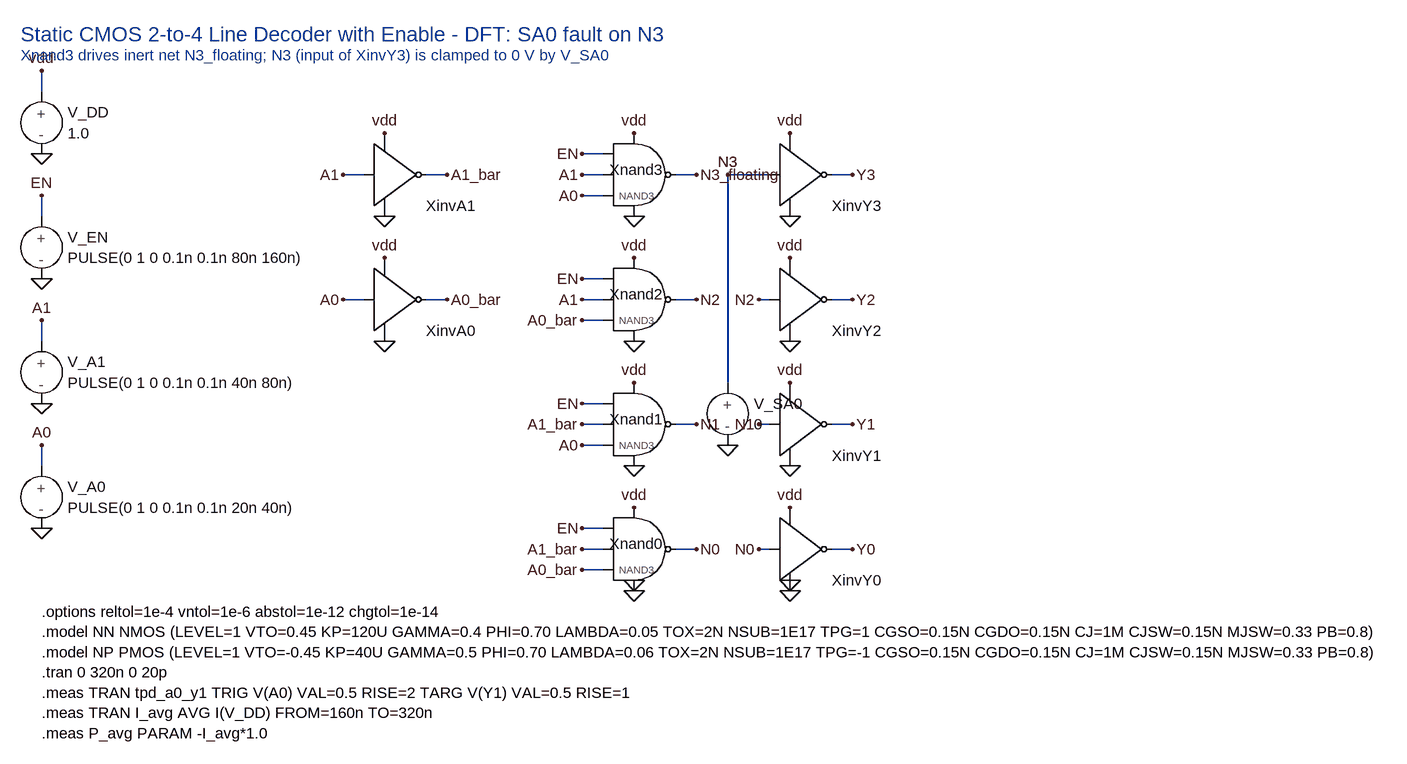
[diagram p0: schematic decoder_dft_sa0.asc]
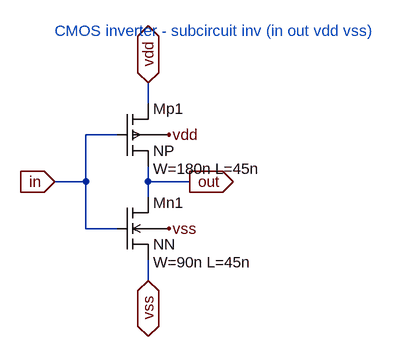
[diagram p1: sub-circuit inv.asc]
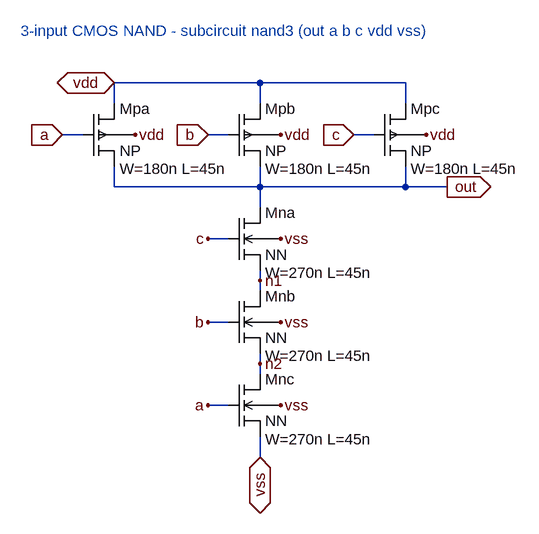
[diagram p2: sub-circuit nand3.asc]
decoder_dft_sa0.asc, the LTspice schematic file:
Version 4
SHEET 1 1744 1248
TEXT 64 24 Left 3 ;Static CMOS 2-to-4 Line Decoder with Enable - DFT: SA0 fault on N3
TEXT 64 56 Left 2 ;Xnand3 drives inert net N3_floating; N3 (input of XinvY3) is clamped to 0 V by V_SA0
SYMBOL vsrc_tb 96 112 R0
SYMATTR InstName V_DD
SYMATTR Value 1.0
WIRE 96 112 96 80
FLAG 96 80 vdd
FLAG 96 208 0
SYMBOL vsrc_tb 96 304 R0
SYMATTR InstName V_EN
SYMATTR Value PULSE(0 1 0 0.1n 0.1n 80n 160n)
WIRE 96 304 96 272
FLAG 96 272 EN
FLAG 96 400 0
SYMBOL vsrc_tb 96 496 R0
SYMATTR InstName V_A1
SYMATTR Value PULSE(0 1 0 0.1n 0.1n 40n 80n)
WIRE 96 496 96 464
FLAG 96 464 A1
FLAG 96 592 0
SYMBOL vsrc_tb 96 688 R0
SYMATTR InstName V_A0
SYMATTR Value PULSE(0 1 0 0.1n 0.1n 20n 40n)
WIRE 96 688 96 656
FLAG 96 656 A0
FLAG 96 784 0
SYMBOL inv 592 192 R0
SYMATTR InstName XinvA1
WIRE 592 240 560 240
FLAG 560 240 A1
WIRE 688 240 720 240
FLAG 720 240 A1_bar
FLAG 624 176 vdd
FLAG 624 304 0
SYMBOL inv 592 384 R0
SYMATTR InstName XinvA0
WIRE 592 432 560 432
FLAG 560 432 A0
WIRE 688 432 720 432
FLAG 720 432 A0_bar
FLAG 624 368 vdd
FLAG 624 496 0
SYMBOL nand3 960 192 R0
SYMATTR InstName Xnand3
WIRE 960 208 928 208
FLAG 928 208 EN
WIRE 960 240 928 240
FLAG 928 240 A1
WIRE 960 272 928 272
FLAG 928 272 A0
FLAG 1008 176 vdd
FLAG 1008 304 0
WIRE 1072 240 1104 240
FLAG 1104 240 N3_floating
SYMBOL inv 1216 192 R0
SYMATTR InstName XinvY3
WIRE 1216 240 1152 240
FLAG 1152 240 N3
FLAG 1248 176 vdd
FLAG 1248 304 0
WIRE 1312 240 1344 240
FLAG 1344 240 Y3
SYMBOL vsrc_tb 1152 560 R0
SYMATTR InstName V_SA0
SYMATTR Value 0
WIRE 1152 560 1152 240
FLAG 1152 240 N3
FLAG 1152 656 0
SYMBOL nand3 960 384 R0
SYMATTR InstName Xnand2
WIRE 960 400 928 400
FLAG 928 400 EN
WIRE 960 432 928 432
FLAG 928 432 A1
WIRE 960 464 928 464
FLAG 928 464 A0_bar
FLAG 1008 368 vdd
FLAG 1008 496 0
WIRE 1072 432 1104 432
FLAG 1104 432 N2
SYMBOL inv 1216 384 R0
SYMATTR InstName XinvY2
WIRE 1216 432 1200 432
FLAG 1200 432 N2
FLAG 1248 368 vdd
FLAG 1248 496 0
WIRE 1312 432 1344 432
FLAG 1344 432 Y2
SYMBOL nand3 960 576 R0
SYMATTR InstName Xnand1
WIRE 960 592 928 592
FLAG 928 592 EN
WIRE 960 624 928 624
FLAG 928 624 A1_bar
WIRE 960 656 928 656
FLAG 928 656 A0
FLAG 1008 560 vdd
FLAG 1008 688 0
WIRE 1072 624 1104 624
FLAG 1104 624 N1
SYMBOL inv 1216 576 R0
SYMATTR InstName XinvY1
WIRE 1216 624 1200 624
FLAG 1200 624 N1
FLAG 1248 560 vdd
FLAG 1248 688 0
WIRE 1312 624 1344 624
FLAG 1344 624 Y1
SYMBOL nand3 960 768 R0
SYMATTR InstName Xnand0
WIRE 960 784 928 784
FLAG 928 784 EN
WIRE 960 816 928 816
FLAG 928 816 A1_bar
WIRE 960 848 928 848
FLAG 928 848 A0_bar
FLAG 1008 752 vdd
FLAG 1008 864 0
FLAG 1008 880 0
WIRE 1072 816 1104 816
FLAG 1104 816 N0
SYMBOL inv 1216 768 R0
SYMATTR InstName XinvY0
WIRE 1216 816 1200 816
FLAG 1200 816 N0
FLAG 1248 752 vdd
FLAG 1248 864 0
FLAG 1248 880 0
WIRE 1312 816 1344 816
FLAG 1344 816 Y0
TEXT 96 912 Left 2 !.options reltol=1e-4 vntol=1e-6 abstol=1e-12 chgtol=1e-14\n.model NN NMOS (LEVEL=1 VTO=0.45 KP=120U GAMMA=0.4 PHI=0.70 LAMBDA=0.05 TOX=2N NSUB=1E17 TPG=1 CGSO=0.15N CGDO=0.15N CJ=1M CJSW=0.15N MJSW=0.33 PB=0.8)\n.model NP PMOS (LEVEL=1 VTO=-0.45 KP=40U GAMMA=0.5 PHI=0.70 LAMBDA=0.06 TOX=2N NSUB=1E17 TPG=-1 CGSO=0.15N CGDO=0.15N CJ=1M CJSW=0.15N MJSW=0.33 PB=0.8)\n.tran 0 320n 0 20p\n.meas TRAN tpd_a0_y1 TRIG V(A0) VAL=0.5 RISE=2 TARG V(Y1) VAL=0.5 RISE=1\n.meas TRAN I_avg AVG I(V_DD) FROM=160n TO=320n\n.meas P_avg PARAM -I_avg*1.0

inv.asc, the sub-circuit schematic file:
Version 4
SHEET 1 1100 800
TEXT 64 -16 Left 2 ;CMOS inverter - subcircuit inv (in out vdd vss)
SYMBOL mp 160 96 R0
SYMATTR InstName Mp1
SYMATTR Value NP
SYMATTR SpiceLine W=180n L=45n
SYMBOL mn 160 240 R0
SYMATTR InstName Mn1
SYMATTR Value NN
SYMATTR SpiceLine W=90n L=45n
WIRE 208 96 208 64
FLAG 208 64 vdd
IOPIN 208 64 BiDir
FLAG 240 144 vdd
WIRE 208 192 208 216
WIRE 208 216 208 240
WIRE 208 216 272 216
FLAG 272 216 out
IOPIN 272 216 Out
WIRE 160 144 112 144
WIRE 112 144 112 216
WIRE 112 216 112 288
WIRE 112 288 160 288
WIRE 112 216 64 216
FLAG 64 216 in
IOPIN 64 216 In
FLAG 240 288 vss
WIRE 208 336 208 368
FLAG 208 368 vss
IOPIN 208 368 BiDir

nand3.asc, the sub-circuit schematic file:
Version 4
SHEET 1 1100 840
TEXT 64 -16 Left 2 ;3-input CMOS NAND - subcircuit nand3 (out a b c vdd vss)
SYMBOL mp 160 96 R0
SYMATTR InstName Mpa
SYMATTR Value NP
SYMATTR SpiceLine W=180n L=45n
WIRE 208 96 208 64
FLAG 240 144 vdd
WIRE 160 144 128 144
FLAG 128 144 a
IOPIN 128 144 In
WIRE 208 192 208 224
SYMBOL mp 384 96 R0
SYMATTR InstName Mpb
SYMATTR Value NP
SYMATTR SpiceLine W=180n L=45n
WIRE 432 96 432 64
FLAG 464 144 vdd
WIRE 384 144 352 144
FLAG 352 144 b
IOPIN 352 144 In
WIRE 432 192 432 224
SYMBOL mp 608 96 R0
SYMATTR InstName Mpc
SYMATTR Value NP
SYMATTR SpiceLine W=180n L=45n
WIRE 656 96 656 64
FLAG 688 144 vdd
WIRE 608 144 576 144
FLAG 576 144 c
IOPIN 576 144 In
WIRE 656 192 656 224
WIRE 208 64 432 64
WIRE 432 64 656 64
FLAG 208 64 vdd
IOPIN 208 64 BiDir
WIRE 208 224 432 224
WIRE 432 224 656 224
WIRE 656 224 720 224
FLAG 720 224 out
IOPIN 720 224 Out
WIRE 432 224 432 256
SYMBOL mn 384 256 R0
SYMATTR InstName Mna
SYMATTR Value NN
SYMATTR SpiceLine W=270n L=45n
FLAG 464 304 vss
WIRE 384 304 352 304
FLAG 352 304 c
SYMBOL mn 384 384 R0
SYMATTR InstName Mnb
SYMATTR Value NN
SYMATTR SpiceLine W=270n L=45n
FLAG 464 432 vss
WIRE 384 432 352 432
FLAG 352 432 b
SYMBOL mn 384 512 R0
SYMATTR InstName Mnc
SYMATTR Value NN
SYMATTR SpiceLine W=270n L=45n
FLAG 464 560 vss
WIRE 384 560 352 560
FLAG 352 560 a
WIRE 432 352 432 368
WIRE 432 368 432 384
FLAG 432 368 n1
WIRE 432 480 432 496
WIRE 432 496 432 512
FLAG 432 496 n2
WIRE 432 608 432 640
FLAG 432 640 vss
IOPIN 432 640 BiDir

The netlist it stands for:
* decoder_dft_sa0.asc
V_DD vdd 0 1.0
V_EN EN 0 PULSE(0 1 0 0.1n 0.1n 80n 160n)
V_A1 A1 0 PULSE(0 1 0 0.1n 0.1n 40n 80n)
V_A0 A0 0 PULSE(0 1 0 0.1n 0.1n 20n 40n)
XXinvA1 A1 A1_bar vdd 0 inv
XXinvA0 A0 A0_bar vdd 0 inv
XXnand3 N3_floating EN A1 A0 vdd 0 nand3
XXinvY3 N3 Y3 vdd 0 inv
V_SA0 N3 0 0
XXnand2 N2 EN A1 A0_bar vdd 0 nand3
XXinvY2 N2 Y2 vdd 0 inv
XXnand1 N1 EN A1_bar A0 vdd 0 nand3
XXinvY1 N1 Y1 vdd 0 inv
XXnand0 N0 EN A1_bar A0_bar vdd 0 nand3
XXinvY0 N0 Y0 vdd 0 inv

* block symbol definitions
.subckt inv in out vdd vss
Mp1 out in vdd vdd NP W=180n L=45n
Mn1 out in vss vss NN W=90n L=45n
* CMOS inverter - subcircuit inv (in out vdd vss)
.ends inv

.subckt nand3 out a b c vdd vss
Mpa out a vdd vdd NP W=180n L=45n
Mpb out b vdd vdd NP W=180n L=45n
Mpc out c vdd vdd NP W=180n L=45n
Mna out c n1 vss NN W=270n L=45n
Mnb n1 b n2 vss NN W=270n L=45n
Mnc n2 a vss vss NN W=270n L=45n
* 3-input CMOS NAND - subcircuit nand3 (out a b c vdd vss)
.ends nand3

.model NMOS NMOS
.model PMOS PMOS
.lib standard.mos
* Static CMOS 2-to-4 Line Decoder with Enable - DFT: SA0 fault on N3
* Xnand3 drives inert net N3_floating; N3 (input of XinvY3) is clamped to 0 V by V_SA0
.options reltol=1e-4 vntol=1e-6 abstol=1e-12 chgtol=1e-14
.model NN NMOS (LEVEL=1 VTO=0.45 KP=120U GAMMA=0.4 PHI=0.70 LAMBDA=0.05 TOX=2N NSUB=1E17 TPG=1 CGSO=0.15N CGDO=0.15N CJ=1M CJSW=0.15N MJSW=0.33 PB=0.8)
.model NP PMOS (LEVEL=1 VTO=-0.45 KP=40U GAMMA=0.5 PHI=0.70 LAMBDA=0.06 TOX=2N NSUB=1E17 TPG=-1 CGSO=0.15N CGDO=0.15N CJ=1M CJSW=0.15N MJSW=0.33 PB=0.8)
.tran 0 320n 0 20p
.meas TRAN tpd_a0_y1 TRIG V(A0) VAL=0.5 RISE=2 TARG V(Y1) VAL=0.5 RISE=1
.meas TRAN I_avg AVG I(V_DD) FROM=160n TO=320n
.meas P_avg PARAM -I_avg*1.0
.backanno
.end